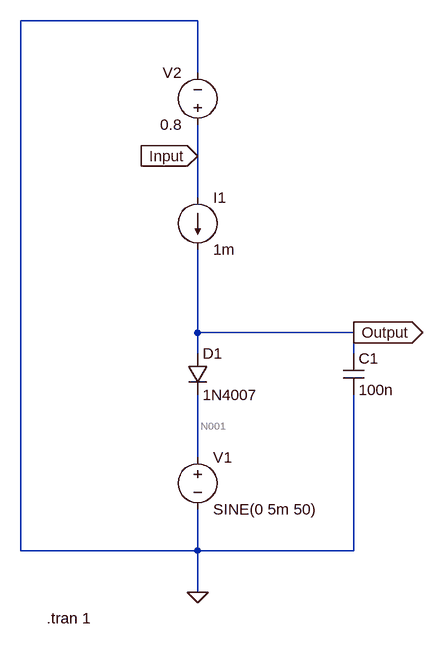
[diagram p0: schematic part3-3.1.asc]
part3-3.1.asc, the LTspice schematic file:
Version 4.1
SHEET 1 880 816
WIRE 160 -224 -112 -224
WIRE 160 -144 160 -224
WIRE 160 -16 160 -64
WIRE 160 48 160 -16
WIRE 160 256 160 128
WIRE 400 256 160 256
WIRE 160 288 160 256
WIRE 400 288 400 256
WIRE 160 448 160 352
WIRE -112 592 -112 -224
WIRE 160 592 160 528
WIRE 160 592 -112 592
WIRE 400 592 400 352
WIRE 400 592 160 592
WIRE 160 656 160 592
FLAG 160 656 0
FLAG 160 -16 Input
IOPIN 160 -16 In
FLAG 400 256 Output
IOPIN 400 256 Out
SYMBOL current 160 48 R0
WINDOW 123 0 0 Left 0
WINDOW 39 0 0 Left 0
SYMATTR InstName I1
SYMATTR Value 1m
SYMBOL diode 144 288 R0
SYMATTR InstName D1
SYMATTR Value 1N4007
SYMBOL cap 384 288 R0
SYMATTR InstName C1
SYMATTR Value 100n
SYMBOL voltage 160 432 R0
WINDOW 123 0 0 Left 0
WINDOW 39 0 0 Left 0
SYMATTR InstName V1
SYMATTR Value SINE(0 5m 50)
SYMBOL voltage 160 -48 R180
WINDOW 0 24 96 Left 2
WINDOW 3 24 16 Left 2
WINDOW 123 0 0 Left 0
WINDOW 39 0 0 Left 0
SYMATTR InstName V2
SYMATTR Value 0.8
TEXT -72 696 Left 2 !.tran 1

The netlist it stands for:
* part3-3.1.asc
I1 Input Output 1m
D1 Output N001 1N4007
C1 Output 0 100n
V1 N001 0 SINE(0 5m 50)
V2 Input 0 0.8
.model D D
.lib standard.dio
.tran 1
.backanno
.end

* Results of the author's LTspice run, read from the files saved beside the schematic
* Operating Point, zero values left out:
*   V(output) = 587.5 mV
*   V(input) = 800 mV
*   I(I1) = 1 mA
*   I(V2) = -1 mA
*   I(V1) = 1 mA
*   I(D1) = 1 mA
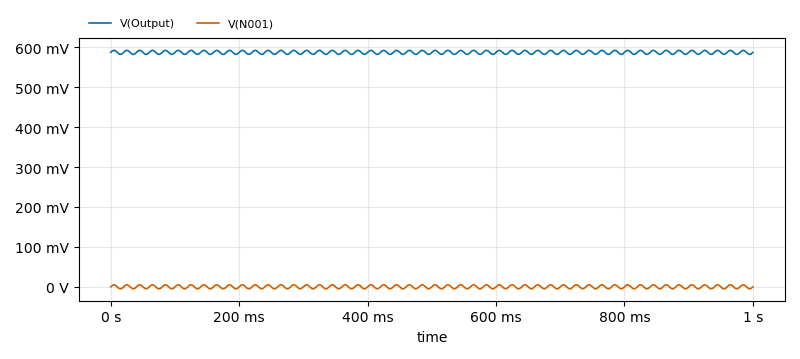
[diagram p1: Transient Analysis of part3-3.1.asc, plotted from the saved traces]
* Transient Analysis, 1 run:
*   V(Output): min 582.5 mV, max 592.5 mV, average 587.5 mV, rms 587.5 mV, last 587.5 mV
*   V(N001): min -5 mV, max 5 mV, average -10.86 nV, rms 3.541 mV, last 0 V